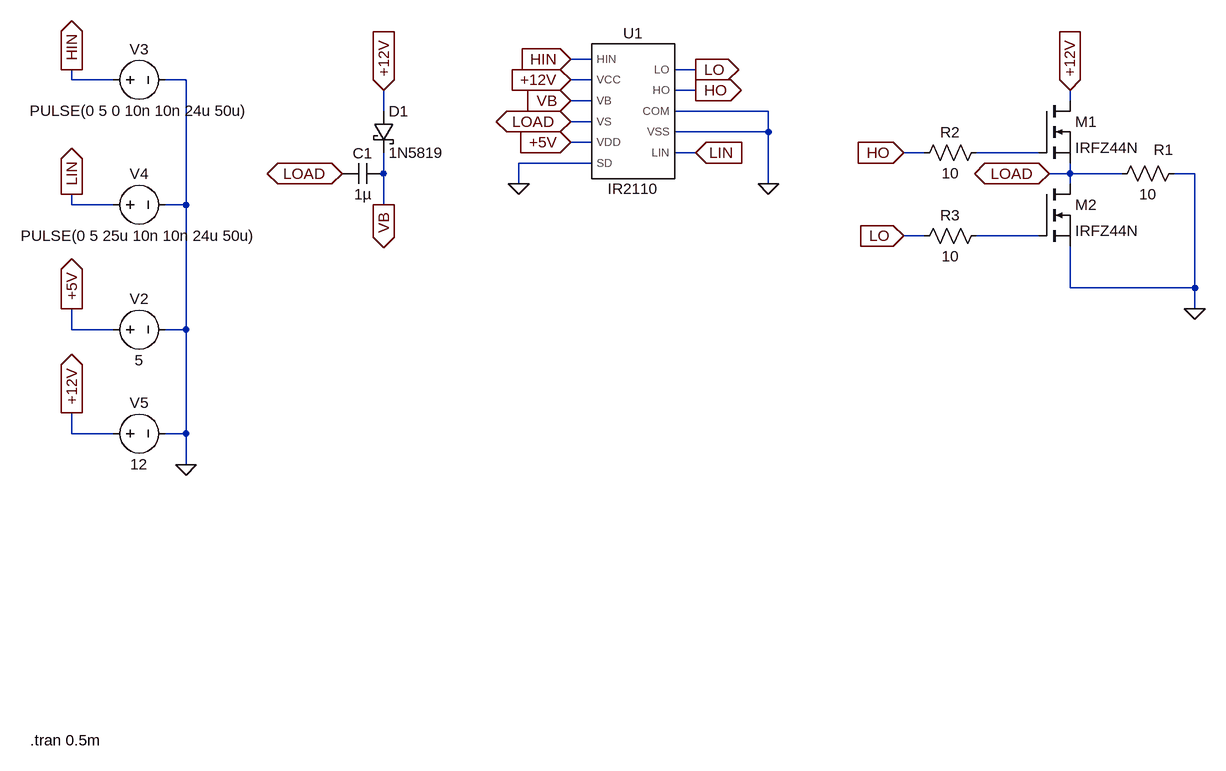
[diagram p0: schematic main.asc]
main.asc, the LTspice schematic file:
Version 4.1
SHEET 1 1748 680
WIRE 752 -544 720 -544
WIRE 912 -528 880 -528
WIRE -48 -512 -48 -528
WIRE 16 -512 -48 -512
WIRE 128 -512 96 -512
WIRE 752 -512 720 -512
WIRE 912 -496 880 -496
WIRE 752 -480 720 -480
WIRE 1488 -480 1488 -496
WIRE 432 -464 432 -496
WIRE 1024 -464 880 -464
WIRE 752 -448 720 -448
WIRE 1024 -432 1024 -464
WIRE 1024 -432 880 -432
WIRE 752 -416 720 -416
WIRE 912 -400 880 -400
WIRE 1264 -400 1232 -400
WIRE 1440 -400 1344 -400
WIRE 752 -384 640 -384
WIRE 432 -368 432 -400
WIRE 1488 -368 1488 -384
WIRE 1488 -368 1456 -368
WIRE 1568 -368 1488 -368
WIRE 1680 -368 1648 -368
WIRE 640 -352 640 -384
WIRE 1024 -352 1024 -432
WIRE 1488 -352 1488 -368
WIRE -48 -320 -48 -336
WIRE 16 -320 -48 -320
WIRE 128 -320 128 -512
WIRE 128 -320 96 -320
WIRE 432 -320 432 -368
WIRE 1264 -272 1232 -272
WIRE 1440 -272 1344 -272
WIRE 1488 -192 1488 -256
WIRE 1680 -192 1680 -368
WIRE 1680 -192 1488 -192
WIRE 1680 -160 1680 -192
WIRE -48 -128 -48 -160
WIRE 16 -128 -48 -128
WIRE 128 -128 128 -320
WIRE 128 -128 96 -128
WIRE -48 32 -48 0
WIRE 16 32 -48 32
WIRE 128 32 128 -128
WIRE 128 32 96 32
WIRE 128 80 128 32
FLAG 720 -512 +12V
IOPIN 720 -512 In
FLAG 912 -496 HO
IOPIN 912 -496 Out
FLAG 912 -528 LO
IOPIN 912 -528 Out
FLAG 1024 -352 0
FLAG -48 -160 +5V
IOPIN -48 -160 Out
FLAG 640 -352 0
FLAG 720 -544 HIN
IOPIN 720 -544 In
FLAG 912 -400 LIN
IOPIN 912 -400 In
FLAG 1680 -160 0
FLAG 1488 -496 +12V
IOPIN 1488 -496 In
FLAG 1232 -272 LO
IOPIN 1232 -272 In
FLAG 1232 -400 HO
IOPIN 1232 -400 In
FLAG -48 -528 HIN
IOPIN -48 -528 Out
FLAG -48 -336 LIN
IOPIN -48 -336 Out
FLAG 720 -416 +5V
IOPIN 720 -416 In
FLAG 1456 -368 LOAD
IOPIN 1456 -368 BiDir
FLAG 720 -448 LOAD
IOPIN 720 -448 BiDir
FLAG 720 -480 VB
IOPIN 720 -480 In
FLAG 432 -496 +12V
IOPIN 432 -496 In
FLAG 432 -320 VB
IOPIN 432 -320 Out
FLAG 368 -368 LOAD
IOPIN 368 -368 BiDir
FLAG -48 0 +12V
IOPIN -48 0 Out
FLAG 128 80 0
SYMBOL IR2110 816 -464 M0
SYMATTR InstName U1
SYMBOL voltage 0 -128 R270
WINDOW 0 32 56 VTop 2
WINDOW 3 -32 56 VBottom 2
WINDOW 123 0 0 Left 0
WINDOW 39 0 0 Left 0
SYMATTR InstName V2
SYMATTR Value 5
SYMBOL nmos 1440 -480 R0
SYMATTR InstName M1
SYMATTR Value IRFZ44N
SYMBOL nmos 1440 -352 R0
SYMATTR InstName M2
SYMATTR Value IRFZ44N
SYMBOL res 1664 -384 R90
WINDOW 0 -5 32 VBottom 2
WINDOW 3 32 56 VTop 2
SYMATTR InstName R1
SYMATTR Value 10
SYMBOL res 1360 -416 R90
WINDOW 0 0 56 VBottom 2
WINDOW 3 32 56 VTop 2
SYMATTR InstName R2
SYMATTR Value 10
SYMBOL res 1360 -288 R90
WINDOW 0 0 56 VBottom 2
WINDOW 3 32 56 VTop 2
SYMATTR InstName R3
SYMATTR Value 10
SYMBOL voltage 0 -512 R270
WINDOW 0 32 56 VTop 2
WINDOW 3 -32 56 VBottom 2
WINDOW 123 0 0 Left 0
WINDOW 39 0 0 Left 0
SYMATTR InstName V3
SYMATTR Value PULSE(0 5 0 10n 10n 24u 50u)
SYMBOL voltage 0 -320 R270
WINDOW 0 32 56 VTop 2
WINDOW 3 -32 56 VBottom 2
SYMATTR InstName V4
SYMATTR Value PULSE(0 5 25u 10n 10n 24u 50u)
SYMBOL schottky 416 -464 R0
SYMATTR InstName D1
SYMATTR Value 1N5819
SYMATTR Description Diode
SYMATTR Type diode
SYMBOL cap 432 -384 R90
WINDOW 0 0 32 VBottom 2
WINDOW 3 32 32 VTop 2
SYMATTR InstName C1
SYMATTR Value 1µ
SYMBOL voltage 0 32 R270
WINDOW 0 32 56 VTop 2
WINDOW 3 -32 56 VBottom 2
WINDOW 123 0 0 Left 0
WINDOW 39 0 0 Left 0
SYMATTR InstName V5
SYMATTR Value 12
TEXT -112 504 Left 2 !.tran 0.5m

The netlist it stands for:
* main.asc
X§U1 LO HO 0 0 LIN HIN +12V VB LOAD +5V 0 IR2110  ; pins LO HO COM VSS LIN HIN VCC VB VS VDD SD
V2 +5V 0 5
M1 +12V N001 LOAD LOAD IRFZ44N
M2 LOAD N002 0 0 IRFZ44N
R1 0 LOAD 10
R2 N001 HO 10
R3 N002 LO 10
V3 HIN 0 PULSE(0 5 0 10n 10n 24u 50u)
V4 LIN 0 PULSE(0 5 25u 10n 10n 24u 50u)
D1 +12V VB 1N5819
C1 VB LOAD 1µ
V5 +12V 0 12
.model D D
.lib standard.dio
.model NMOS NMOS
.model PMOS PMOS
.lib standard.mos
.tran 0.5m
.lib IR2110.lib
.backanno
.end